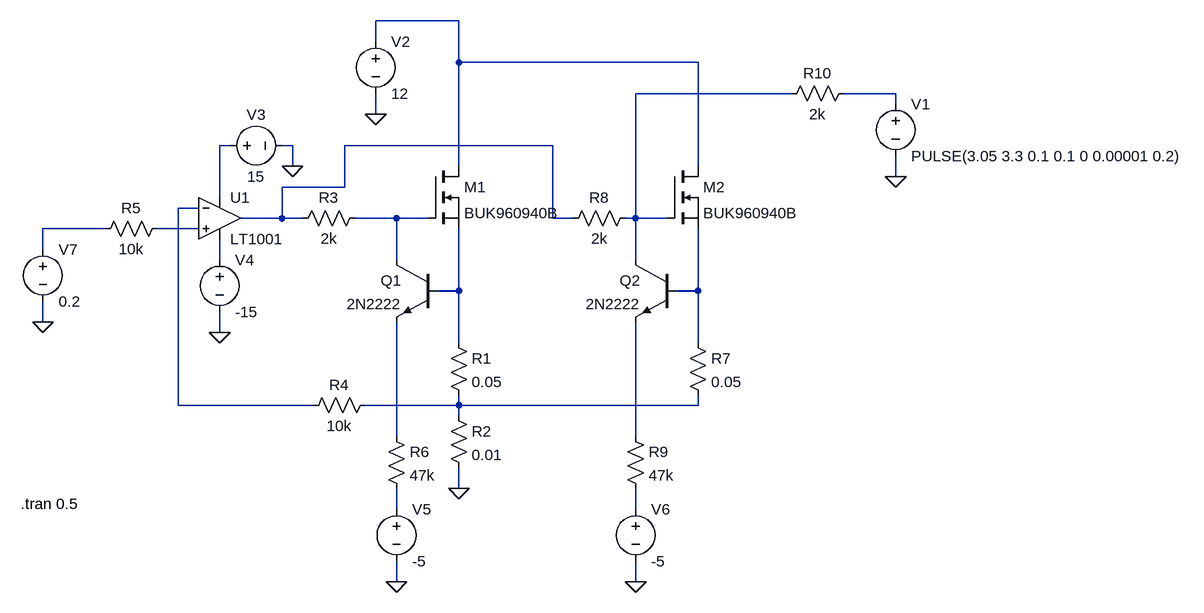
[diagram p0: schematic dc_load_protection_thermal_runaway.asc]
dc_load_protection_thermal_runaway.asc, the LTspice schematic file:
Version 4
SHEET 1 1648 708
WIRE 384 -176 256 -176
WIRE 256 -144 256 -176
WIRE 384 -112 384 -176
WIRE 752 -112 384 -112
WIRE 896 -64 656 -64
WIRE 1056 -64 976 -64
WIRE 1056 -48 1056 -64
WIRE 256 -32 256 -64
WIRE 32 16 16 16
WIRE 128 16 112 16
WIRE 528 16 208 16
WIRE 128 48 128 16
WIRE 384 48 384 -112
WIRE 752 48 752 -112
WIRE 1056 64 1056 32
WIRE 208 80 208 16
WIRE 208 80 112 80
WIRE 16 96 16 16
WIRE -16 112 -48 112
WIRE 112 128 112 80
WIRE 112 128 48 128
WIRE 144 128 112 128
WIRE 288 128 224 128
WIRE 336 128 288 128
WIRE 528 128 528 16
WIRE 560 128 528 128
WIRE 656 128 656 -64
WIRE 656 128 640 128
WIRE 704 128 656 128
WIRE -160 144 -256 144
WIRE -16 144 -80 144
WIRE -256 176 -256 144
WIRE 16 192 16 160
WIRE 288 192 288 128
WIRE 656 192 656 128
WIRE 384 240 384 144
WIRE 384 240 352 240
WIRE 752 240 752 144
WIRE 752 240 720 240
WIRE -256 288 -256 256
WIRE 16 304 16 272
WIRE 384 320 384 240
WIRE 752 320 752 240
WIRE -48 416 -48 112
WIRE 160 416 -48 416
WIRE 384 416 384 400
WIRE 384 416 240 416
WIRE 752 416 752 400
WIRE 752 416 384 416
WIRE 384 432 384 416
WIRE 288 464 288 288
WIRE 656 464 656 288
WIRE 384 544 384 512
WIRE 288 576 288 544
WIRE 656 576 656 544
WIRE 288 688 288 656
WIRE 656 688 656 656
FLAG -256 288 0
FLAG 128 48 0
FLAG 256 -32 0
FLAG 16 304 0
FLAG 384 544 0
FLAG 288 688 0
FLAG 656 688 0
FLAG 1056 64 0
SYMBOL Opamps\\LT1001 16 64 R0
SYMATTR InstName U1
SYMBOL res 368 304 R0
SYMATTR InstName R1
SYMATTR Value 0.05
SYMBOL res 368 416 R0
SYMATTR InstName R2
SYMATTR Value 0.01
SYMBOL res 128 144 R270
WINDOW 0 32 56 VTop 2
WINDOW 3 0 56 VBottom 2
SYMATTR InstName R3
SYMATTR Value 2k
SYMBOL res 144 432 R270
WINDOW 0 32 56 VTop 2
WINDOW 3 0 56 VBottom 2
SYMATTR InstName R4
SYMATTR Value 10k
SYMBOL res -176 160 R270
WINDOW 0 32 56 VTop 2
WINDOW 3 0 56 VBottom 2
SYMATTR InstName R5
SYMATTR Value 10k
SYMBOL voltage 1056 -64 R0
WINDOW 123 0 0 Left 2
WINDOW 39 0 0 Left 2
SYMATTR InstName V1
SYMATTR Value PULSE(3.05 3.3 0.1 0.1 0 0.00001 0.2)
SYMBOL voltage 256 -160 R0
WINDOW 123 0 0 Left 2
WINDOW 39 0 0 Left 2
SYMATTR InstName V2
SYMATTR Value 12
SYMBOL voltage 16 16 R270
WINDOW 0 32 56 VTop 2
WINDOW 3 -32 56 VBottom 2
WINDOW 123 0 0 Left 2
WINDOW 39 0 0 Left 2
SYMATTR InstName V3
SYMATTR Value 15
SYMBOL voltage 16 176 R0
WINDOW 123 0 0 Left 2
WINDOW 39 0 0 Left 2
SYMATTR InstName V4
SYMATTR Value -15
SYMBOL nmos 336 48 R0
SYMATTR InstName M1
SYMATTR Value BUK960940B
SYMBOL npn 352 192 M0
SYMATTR InstName Q1
SYMATTR Value 2N2222
SYMBOL res 272 448 R0
SYMATTR InstName R6
SYMATTR Value 47k
SYMBOL voltage 288 560 R0
WINDOW 123 0 0 Left 2
WINDOW 39 0 0 Left 2
SYMATTR InstName V5
SYMATTR Value -5
SYMBOL res 736 304 R0
SYMATTR InstName R7
SYMATTR Value 0.05
SYMBOL nmos 704 48 R0
SYMATTR InstName M2
SYMATTR Value BUK960940B
SYMBOL npn 720 192 M0
SYMATTR InstName Q2
SYMATTR Value 2N2222
SYMBOL res 640 448 R0
SYMATTR InstName R9
SYMATTR Value 47k
SYMBOL voltage 656 560 R0
WINDOW 123 0 0 Left 2
WINDOW 39 0 0 Left 2
SYMATTR InstName V6
SYMATTR Value -5
SYMBOL res 544 144 R270
WINDOW 0 32 56 VTop 2
WINDOW 3 0 56 VBottom 2
SYMATTR InstName R8
SYMATTR Value 2k
SYMBOL res 880 -48 R270
WINDOW 0 32 56 VTop 2
WINDOW 3 0 56 VBottom 2
SYMATTR InstName R10
SYMATTR Value 2k
SYMBOL voltage -256 160 R0
WINDOW 123 0 0 Left 2
WINDOW 39 0 0 Left 2
SYMATTR InstName V7
SYMATTR Value 0.2
TEXT -290 568 Left 2 !.tran 0.5

The netlist it stands for:
* dc_load_protection_thermal_runaway.asc
XU1 N009 N006 N004 N010 N005 LT1001  ; pins In+ In- V+ V- OUT
R1 N011 N013 0.05
R2 N013 0 0.01
R3 N005 N007 2k
R4 N006 N013 10k
R5 N008 N009 10k
V1 N003 0 PULSE(3.05 3.3 0.1 0.1 0 0.00001 0.2)
V2 N001 0 12
V3 N004 0 15
V4 N010 0 -15
M1 N001 N007 N011 N011 BUK960940B
Q1 N007 N011 N014 0 2N2222
R6 N014 N016 47k
V5 N016 0 -5
R7 N012 N013 0.05
M2 N001 N002 N012 N012 BUK960940B
Q2 N002 N012 N015 0 2N2222
R9 N015 N017 47k
V6 N017 0 -5
R8 N005 N002 2k
R10 N002 N003 2k
V7 N008 0 0.2
.model NPN NPN
.model PNP PNP
.lib standard.bjt
.model NMOS NMOS
.model PMOS PMOS
.lib standard.mos
.tran 0.5
.lib LTC.lib
.backanno
.end